# Altium project Bracelet_Main.PrjPcb (part 1 of 2)
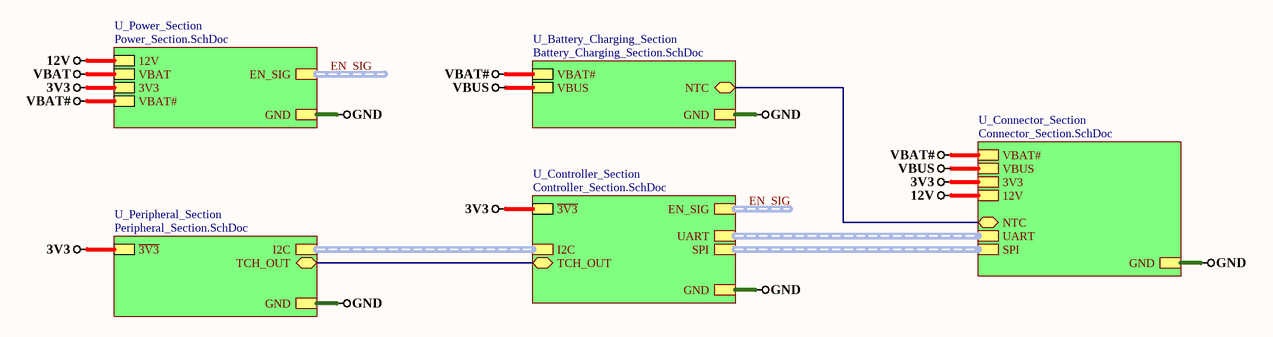
[diagram p0: Top_Sheet.SchDoc]
9 sheets, 115 parts. Net scope: hierarchical (ports join the sheet entries above them; power ports are global).
Board file: Bracelet_Main.PcbDoc
Sheets:
  Top_Sheet.SchDoc
    U_Connector_Section = Connector_Section.SchDoc
    U_Power_Section = Power_Section.SchDoc
      U_MCU_Power_Sec = MCU_Power_Sec.SchDoc
      U_LED_Power_Sec = LED_Power_Sec.SchDoc
      U_Fast_Charger_Sec = Fast_Charger_Sec.SchDoc
    U_Peripheral_Section = Peripheral_Section.SchDoc
    U_Controller_Section = Controller_Section.SchDoc
    U_Battery_Charging_Section = Battery_Charging_Section.SchDoc

## Sheet Top_Sheet.SchDoc
size A4; DocumentNumber: 1; SheetNumber: 1; SheetTotal: 9

### Sub-sheets
U_Battery_Charging_Section = Battery_Charging_Section.SchDoc: GND, VBAT#, VBUS, NTC (bidir)
U_Connector_Section = Connector_Section.SchDoc: UART (harness UART), SPI (harness SPI), NTC (bidir), 3V3, 12V, GND, VBUS, VBAT#
U_Controller_Section = Controller_Section.SchDoc: UART (harness UART), I2C (harness I2C), TCH_OUT (bidir), ~{3V3}, GND, SPI (harness SPI), EN_SIG (harness EN_SIG)
U_Peripheral_Section = Peripheral_Section.SchDoc: ~{3V3}, GND, I2C (harness I2C), TCH_OUT (bidir)
U_Power_Section = Power_Section.SchDoc: 12V, GND, VBAT, 3V3, VBAT#, EN_SIG (harness EN_SIG)

### Nets
3V3: sheet U_Connector_Section/3V3, sheet U_Power_Section/3V3, sheet U_Peripheral_Section/~{3V3}, sheet U_Controller_Section/~{3V3}
12V: sheet U_Connector_Section/12V, sheet U_Power_Section/12V
GND: sheet U_Connector_Section/GND, sheet U_Power_Section/GND, sheet U_Peripheral_Section/GND, sheet U_Controller_Section/GND, sheet U_Battery_Charging_Section/GND
VBAT#: sheet U_Connector_Section/VBAT#, sheet U_Power_Section/VBAT#, sheet U_Battery_Charging_Section/VBAT#
VBUS: sheet U_Connector_Section/VBUS, sheet U_Battery_Charging_Section/VBUS
NTC: sheet U_Connector_Section/NTC, sheet U_Battery_Charging_Section/NTC
TCH_OUT: sheet U_Peripheral_Section/TCH_OUT, sheet U_Controller_Section/TCH_OUT

### Buses and harness runs
harness EN_SIG = sheet U_Controller_Section/EN_SIG
harness EN_SIG = sheet U_Power_Section/EN_SIG
harness sheet U_Connector_Section/SPI = sheet U_Controller_Section/SPI
harness sheet U_Connector_Section/UART = sheet U_Controller_Section/UART
harness sheet U_Controller_Section/I2C = sheet U_Peripheral_Section/I2C

## Sheet Connector_Section.SchDoc
size A4; DocumentNumber: 9; SheetNumber: 9; SheetTotal: 9
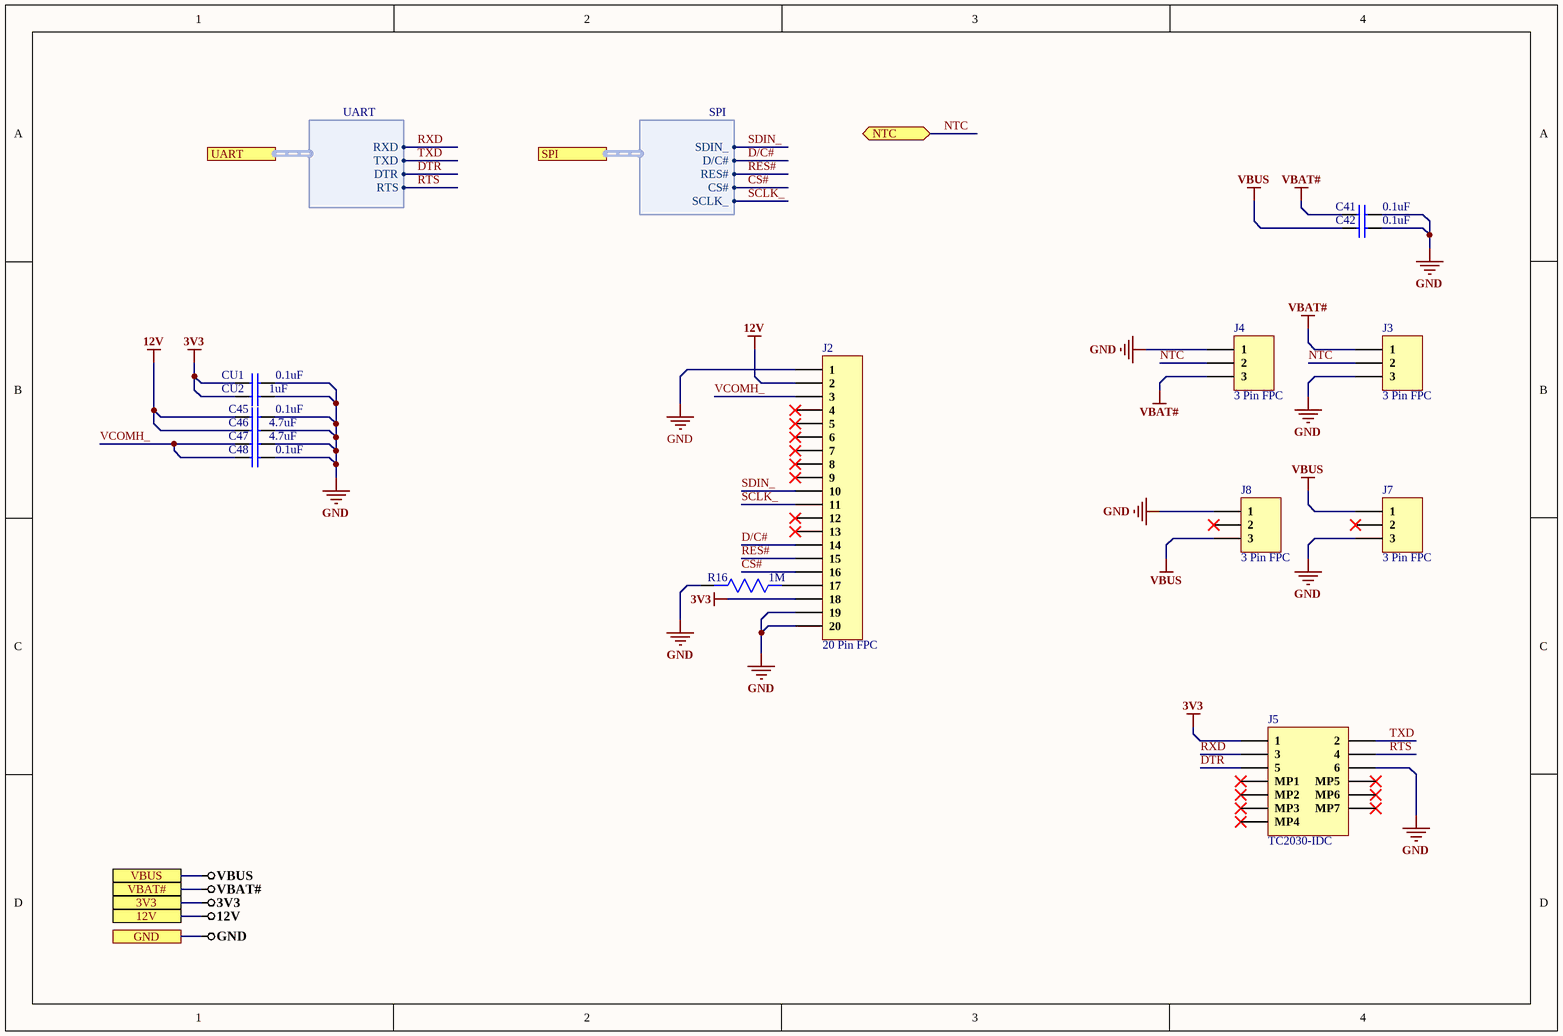
[diagram p1: Connector_Section.SchDoc]

### Parts
C41  0.1uF  [CAP 0201]
C42  0.1uF  [CAP 0201]
C45  0.1uF  [CAP 0201]
C46  4.7uF  [Cap 0402]
C47  4.7uF  [Cap 0402]
C48  0.1uF  [CAP 0201]
CU1  0.1uF  [CAP 0201]
CU2  1uF  [CAP 0201]
J2  20 Pin FPC  [20 Pin FPC]
J3  3 Pin FPC  [3 Pin FPC]
J4  3 Pin FPC  [3 Pin FPC]
J5  TC2030-IDC  [TC2030-IDC]
J7  3 Pin FPC  [3 Pin FPC]
J8  3 Pin FPC  [3 Pin FPC]
R16  1M  [Res-0201]

### Ports
3V3, 12V, GND, NTC (bidir), SPI (harness SPI), UART (harness UART), VBAT#, VBUS

### Harnesses
UART: RXD, TXD, DTR, RTS
SPI: SDIN_, D/C#, RES#, CS#, SCLK_

### Nets
3V3: CU1.1 CU2.1 J2.18 J5.1 ; port 3V3
12V: C45.1 C46.1 J2.2 ; port 12V
GND: C41.2 C42.2 C45.2 C46.2 C47.2 C48.2 CU1.2 CU2.2 J2.1 J2.19 J2.20 J3.3 J4.1 J5.6 J7.3 J8.1 R16.2 ; port GND
VBAT#: C41.1 J3.1 J4.3 ; port VBAT#
VBUS: C42.1 J7.1 J8.3 ; port VBUS
CS#: J2.16 ; port SPI.CS#
D/C#: J2.14 ; port SPI.D/C#
DTR: J5.5 ; port UART.DTR
NTC: J3.2 J4.2 ; port NTC
RES#: J2.15 ; port SPI.RES#
RTS: J5.4 ; port UART.RTS
RXD: J5.3 ; port UART.RXD
SCLK_: J2.11 ; port SPI.SCLK_
SDIN_: J2.10 ; port SPI.SDIN_
TXD: J5.2 ; port UART.TXD
VCOMH_: C47.1 C48.1 J2.3
NetJ2_17: J2.17 R16.1

Not connected (* = marked no-connect by the designer): J2 4* 5* 6* 7* 8* 9* 12* 13*; J5 MP1* MP2* MP3* MP4* MP5* MP6* MP7*; J7 2*; J8 2*

### Library data of the parts
C41 C42 C45 C48 CU1 = GRM033R61E104KE14D: Multilayer Ceramic Capacitors MLCC - SMD/SMT 0201 0.1uF 25volts X5R 10%; Manufacturer: Murata; Capacitance: 100nF; Voltage Rating: 25V; Supplier 1: Mouser; Manufacturer Part Number: GRM033R61E104KE14D; RoHS: Yes; Category: Ceramic Capacitors; Stock 1: 22478; Pricing 1: 1=0.10000, 10=0.03100, 50=0.03100, 100=0.02500, 1000=0.01700, 10000=0.01400 (USD); Mount: Surface Mount; Case/Package: 0201; Case Code (Metric): 0603; Case Code (Imperial): 0201; Weight: 1.2E-05oz; Min Operating Temperature: -55°C; Max Operating Temperature: 85°C; Packaging: Tape and Reel; Tolerance: 10%; Dielectric: X5R; Termination: SMD/SMT; Resistor Type: Ceramic; Voltage Rating (DC): 25V; Package Quantity: 15000; Length: 0.024inch; Width: 0.012inch; Height: 0.3mm; Thickness: 0.013inch; Lead Free: Lead Free; RoHS Compliant: Yes; ComponentLink1URL: http://www.farnell.com/datasheets/2867843.pdf?src-supplier=Farnell; ComponentLink1Description: http://www.farnell.com/datasheets/2867843.pdf?src-supplier=Farnell; ComponentLink2URL: http://www.mouser.com/ds/2/281/c02e-2905.pdf?src-supplier=Mouser; ComponentLink2Description: http://www.mouser.com/ds/2/281/c02e-2905.pdf?src-supplier=Mouser; ComponentLink3URL: http://search.murata.co.jp/Ceramy/image/img/A01X/G101/ENG/GRM033R61E104KE14-01.pdf?src-supplier=Digi-Key; ComponentLink3Description: http://search.murata.co.jp/Ceramy/image/img/A01X/G101/ENG/GRM033R61E104KE14-01.pdf?src-supplier=Digi-Key; ComponentLink4URL: http://www.farnell.com/datasheets/2867843.pdf?src-supplier=Newark; ComponentLink4Description: http://www.farnell.com/datasheets/2867843.pdf?src-supplier=Newark; Supplier Part Number 1: 81-GRM033R61E104KE4D
C46 C47 = CL05A475MO5NUNC: Cap Ceramic 4.7uF 16V X5R 20% SMD 0402 85C T/R; Manufacturer: Samsung; Supplier 1: Avnet; Manufacturer Part Number: CL05A475MO5NUNC; RoHS: Yes; Category: Ceramic Capacitors; Pricing 1: 1=0.63800, 25=0.44600, 100=0.26800, 250=0.23400, 500=0.20000, 1000=0.16900 (USD); Mount: Surface Mount; Case/Package: 0402; Case Code (Metric): 1005; Case Code (Imperial): 0402; Min Operating Temperature: -55°C; Max Operating Temperature: 85°C; Packaging: Tape and Reel; Capacitance: 4.7uF; Voltage Rating: 16V; Tolerance: 20%; Length: 0.039inch; Width: 0.02inch; Thickness: 0.022inch; RoHS Compliant: Yes; ComponentLink1URL: http://www.farnell.com/datasheets/2710653.pdf?src-supplier=Farnell; ComponentLink1Description: http://www.farnell.com/datasheets/2710653.pdf?src-supplier=Farnell; ComponentLink2URL: http://www.farnell.com/datasheets/2710653.pdf?src-supplier=Newark; ComponentLink2Description: http://www.farnell.com/datasheets/2710653.pdf?src-supplier=Newark; ComponentLink3URL: http://www.samsungsem.com/kr/support/product-search/mlcc/CL05A475MO5NUNC.jsp?src-supplier=Digi-Key; ComponentLink3Description: http://www.samsungsem.com/kr/support/product-search/mlcc/CL05A475MO5NUNC.jsp?src-supplier=Digi-Key; Supplier Part Number 1: 82AC9197
CU2 = CL03A105MO3NRNC: Mlcc 0201 X5R1UF16V 20% T: 0.39MM; Manufacturer: Samsung; Supplier 1: Avnet; Manufacturer Part Number: CL03A105MO3NRNC; RoHS: Yes; Category: Ceramic Capacitors; Pricing 1: 100000=0.02840, 120000=0.02800, 220000=0.02720, 500000=0.02660, 1000000=0.02560, 5000000=0.02500, 10000000=0.02440 (USD); RoHS Compliant: Yes; Supplier Part Number 1: CL03A105MO3NRNC
J2 = 20 Pin FPC: CONN FPC 20POS 0.5MM SMD R/A
J3 J4 J7 J8 = 3 Pin FPC: CONN FPC 3POS 0.5MM SMD R/A; ComponentLink1URL: https://www.molex.com/pdm_docs/pk/5051479200-200.pdf?src-supplier=Digi-Key; ComponentLink1Description: https://www.molex.com/pdm_docs/pk/5051479200-200.pdf?src-supplier=Digi-Key; ComponentLink2URL: http://www.molex.com/pdm_docs/sd/5051470390_sd.pdf?src-supplier=Digi-Key; ComponentLink2Description: http://www.molex.com/pdm_docs/sd/5051470390_sd.pdf?src-supplier=Digi-Key; ComponentLink3URL: https://www.molex.com/pdm_docs/sd/5051470390_sd.pdf?src-supplier=Digi-Key; ComponentLink3Description: https://www.molex.com/pdm_docs/sd/5051470390_sd.pdf?src-supplier=Digi-Key
J5 = TC2030-IDC: CABLE ADAPTER 6 POS; Manufacturer: Tag-Connect; ComponentLink1URL: http://www.tag-connect.com/Materials/TC2030-MCP%20Datasheet.pdf?src-supplier=Digi-Key; ComponentLink1Description: http://www.tag-connect.com/Materials/TC2030-MCP%20Datasheet.pdf?src-supplier=Digi-Key; Supplier 1: Digi-Key; Manufacturer Part Number: TC2030-IDC; Stock 1: 284; Pricing 1: 1=43.71 (USD); Package Quantity: 1; Supplier Part Number 1: TC2030-IDC-ND
R16 = WR02X105JAL: Res Thick Film 0201 1M Ohm 5% 0.05W(1/20W) ±200ppm/C Molded SMD Paper T/R; Manufacturer: Walsin Technologies; Resistance: 1MR; Supplier 1: Digi-Key; Manufacturer Part Number: WR02X105JAL; RoHS: Yes; Category: Uncategorized; Stock 1: 6920; Pricing 1: 1=0.10000, 10=0.01800, 100=0.00750, 1000=0.00335, 2500=0.00291, 5000=0.00240 (USD); Case/Package: 0201; Min Operating Temperature: -55°C; Max Operating Temperature: 125°C; Resistor Type: Thick Film; Tolerance: 5%; Packaging: Tape and Reel; Length: 0.6mm; Depth: 0.3mm; Military Standard: Not; ComponentLink1URL: http://components.arrow.com/part/dataview/0323_00666329?src-supplier=Arrow+Europe; ComponentLink1Description: http://components.arrow.com/part/dataview/0323_00666329?src-supplier=Arrow+Europe; Supplier Part Number 1: 1292-WR02X105JALCT-ND

## Sheet Power_Section.SchDoc
size A4; DocumentNumber: 3; SheetNumber: 3; SheetTotal: 9
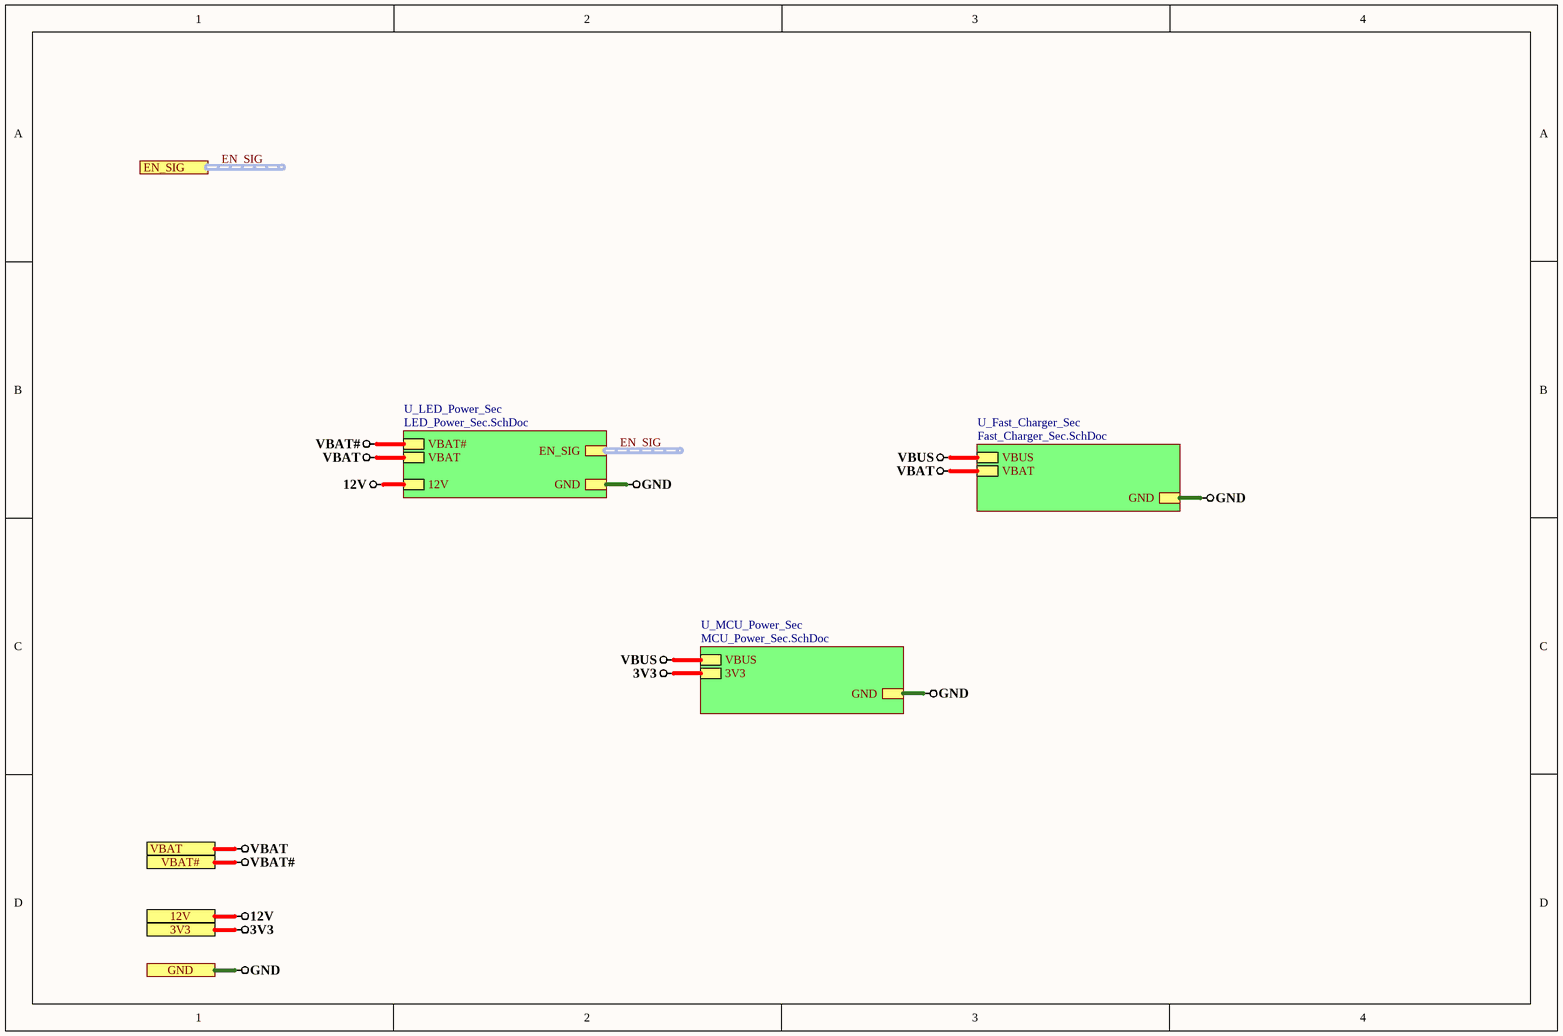
[diagram p2: Power_Section.SchDoc]

### Sub-sheets
U_Fast_Charger_Sec = Fast_Charger_Sec.SchDoc: GND, VBAT, VBUS
U_LED_Power_Sec = LED_Power_Sec.SchDoc: VBAT#, GND, VBAT, 12V, EN_SIG (harness EN_SIG)
U_MCU_Power_Sec = MCU_Power_Sec.SchDoc: VBUS, GND, 3V3

### Ports
3V3, 12V, EN_SIG (harness EN_SIG), GND, VBAT, VBAT#

### Nets
3V3: port 3V3, sheet U_MCU_Power_Sec/3V3
12V: port 12V, sheet U_LED_Power_Sec/12V
GND: port GND, sheet U_MCU_Power_Sec/GND, sheet U_LED_Power_Sec/GND, sheet U_Fast_Charger_Sec/GND
VBAT: port VBAT, sheet U_LED_Power_Sec/VBAT, sheet U_Fast_Charger_Sec/VBAT
VBAT#: port VBAT#, sheet U_LED_Power_Sec/VBAT#
VBUS: sheet U_MCU_Power_Sec/VBUS, sheet U_Fast_Charger_Sec/VBUS

### Buses and harness runs
harness EN_SIG = port EN_SIG
harness EN_SIG = sheet U_LED_Power_Sec/EN_SIG

## Sheet MCU_Power_Sec.SchDoc
size A4; DocumentNumber: 6; SheetNumber: 6; SheetTotal: 9
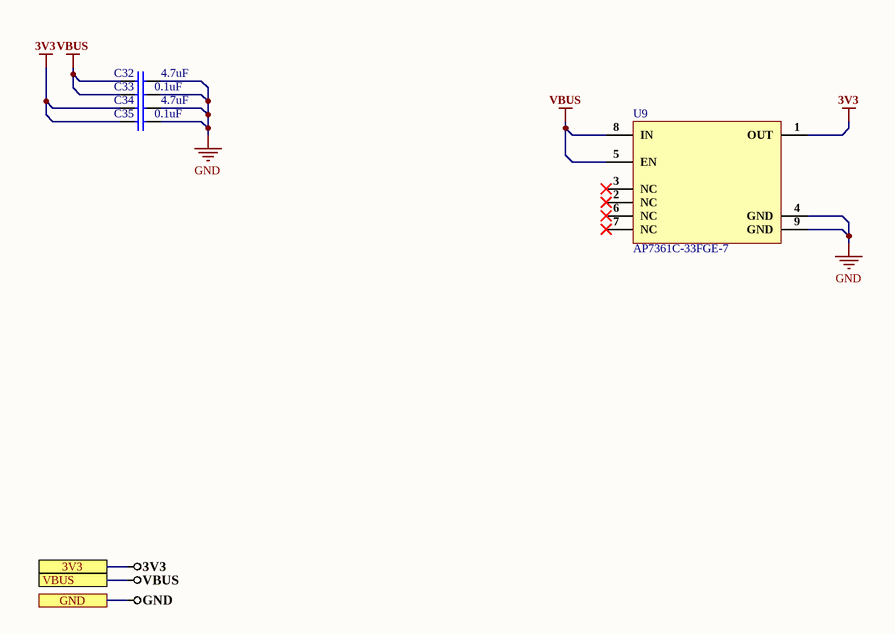
[diagram p3: MCU_Power_Sec.SchDoc]

### Parts
C32  4.7uF  [Cap 0402]
C33  0.1uF  [CAP 0201]
C34  4.7uF  [Cap 0402]
C35  0.1uF  [CAP 0201]
U9  AP7361C-33FGE-7  [U-DFN3030-8]

### Ports
3V3, GND, VBUS

### Nets
3V3: C34.1 C35.1 U9.1(OUT) ; port 3V3
GND: C32.2 C33.2 C34.2 C35.2 U9.4(GND) U9.9(GND) ; port GND
VBUS: C32.1 C33.1 U9.5(EN) U9.8(IN) ; port VBUS

Not connected (* = marked no-connect by the designer): U9 2(NC)* 3(NC)* 6(NC)* 7(NC)*

### Library data of the parts
C32 C34 = CL05A475MO5NUNC: as C46 on sheet Connector_Section; Supplier 1: Avnet; Manufacturer Part Number: CL05A475MO5NUNC; RoHS: Yes; Category: Ceramic Capacitors; Pricing 1: 1=0.63800, 25=0.44600, 100=0.26800, 250=0.23400, 500=0.20000, 1000=0.16900 (USD); Mount: Surface Mount; Case/Package: 0402; Case Code (Metric): 1005; Case Code (Imperial): 0402; Min Operating Temperature: -55°C; Max Operating Temperature: 85°C; Packaging: Tape and Reel; Capacitance: 4.7uF; Voltage Rating: 16V; Tolerance: 20%; Length: 0.039inch; Width: 0.02inch; Thickness: 0.022inch; RoHS Compliant: Yes; ComponentLink1URL: http://www.farnell.com/datasheets/2710653.pdf?src-supplier=Farnell; ComponentLink1Description: http://www.farnell.com/datasheets/2710653.pdf?src-supplier=Farnell; ComponentLink2URL: http://www.farnell.com/datasheets/2710653.pdf?src-supplier=Newark; ComponentLink2Description: http://www.farnell.com/datasheets/2710653.pdf?src-supplier=Newark; ComponentLink3URL: http://www.samsungsem.com/kr/support/product-search/mlcc/CL05A475MO5NUNC.jsp?src-supplier=Digi-Key; ComponentLink3Description: http://www.samsungsem.com/kr/support/product-search/mlcc/CL05A475MO5NUNC.jsp?src-supplier=Digi-Key; Supplier Part Number 1: 82AC9197
C33 C35 = GRM033R61E104KE14D: CAP CER 0.1UF 25V X5R 0201; Manufacturer: Murata; Capacitance: 100nF; Tolerance: 10%; Supplier 1: Mouser; Manufacturer Part Number: GRM033R61E104KE14D; RoHS: Yes; Category: Ceramic Capacitors; Stock 1: 22478; Pricing 1: 1=0.10000, 10=0.03100, 50=0.03100, 100=0.02500, 1000=0.01700, 10000=0.01400 (USD); Mount: Surface Mount; Case/Package: 0201; Case Code (Metric): 0603; Case Code (Imperial): 0201; Weight: 1.2E-05oz; Min Operating Temperature: -55°C; Max Operating Temperature: 85°C; Packaging: Tape and Reel; Voltage Rating: 25V; Dielectric: X5R; Termination: SMD/SMT; Resistor Type: Ceramic; Voltage Rating (DC): 25V; Package Quantity: 15000; Length: 0.024inch; Width: 0.012inch; Height: 0.3mm; Thickness: 0.013inch; Lead Free: Lead Free; RoHS Compliant: Yes; ComponentLink1URL: http://www.farnell.com/datasheets/2867843.pdf?src-supplier=Farnell; ComponentLink1Description: http://www.farnell.com/datasheets/2867843.pdf?src-supplier=Farnell; ComponentLink2URL: http://www.mouser.com/ds/2/281/c02e-2905.pdf?src-supplier=Mouser; ComponentLink2Description: http://www.mouser.com/ds/2/281/c02e-2905.pdf?src-supplier=Mouser; ComponentLink3URL: http://search.murata.co.jp/Ceramy/image/img/A01X/G101/ENG/GRM033R61E104KE14-01.pdf?src-supplier=Digi-Key; ComponentLink3Description: http://search.murata.co.jp/Ceramy/image/img/A01X/G101/ENG/GRM033R61E104KE14-01.pdf?src-supplier=Digi-Key; ComponentLink4URL: http://www.farnell.com/datasheets/2867843.pdf?src-supplier=Newark; ComponentLink4Description: http://www.farnell.com/datasheets/2867843.pdf?src-supplier=Newark; Supplier Part Number 1: 81-GRM033R61E104KE4D
U9 = AP7361C-33FGE-7: IC REG LINEAR 3.3V 1A UDFN3030-8; Manufacturer: Diodes; Dropout Voltage: 360mV; Number of Regulators: 1; Min Current Limit: 1.1A; Supplier 1: Digi-Key; Manufacturer Part Number: AP7361C-33FGE-7; RoHS: Yes; Category: Voltage Regulators - Linear; Stock 1: 84; Pricing 1: 1=0.56000, 10=0.48100, 25=0.44880, 100=0.35910, 250=0.33348, 500=0.28218, 1000=0.21804 (USD); Mount: Surface Mount; Min Operating Temperature: -40°C; Max Operating Temperature: 85°C; Packaging: Tape and Reel; Output Voltage: 3.3V; Output Current: 1A; RoHS Compliant: Yes; ComponentLink1URL: http://www.mouser.com/ds/2/115/AP7361C-775034.pdf?src-supplier=Mouser; ComponentLink1Description: http://www.mouser.com/ds/2/115/AP7361C-775034.pdf?src-supplier=Mouser; ComponentLink2URL: https://www.diodes.com/assets/Datasheets/AP7361C.pdf?src-supplier=Digi-Key; ComponentLink2Description: https://www.diodes.com/assets/Datasheets/AP7361C.pdf?src-supplier=Digi-Key; Supplier Part Number 1: AP7361C-33FGE-7DICT-ND

## Sheet LED_Power_Sec.SchDoc
size A4; DocumentNumber: 4; SheetNumber: 4; SheetTotal: 9
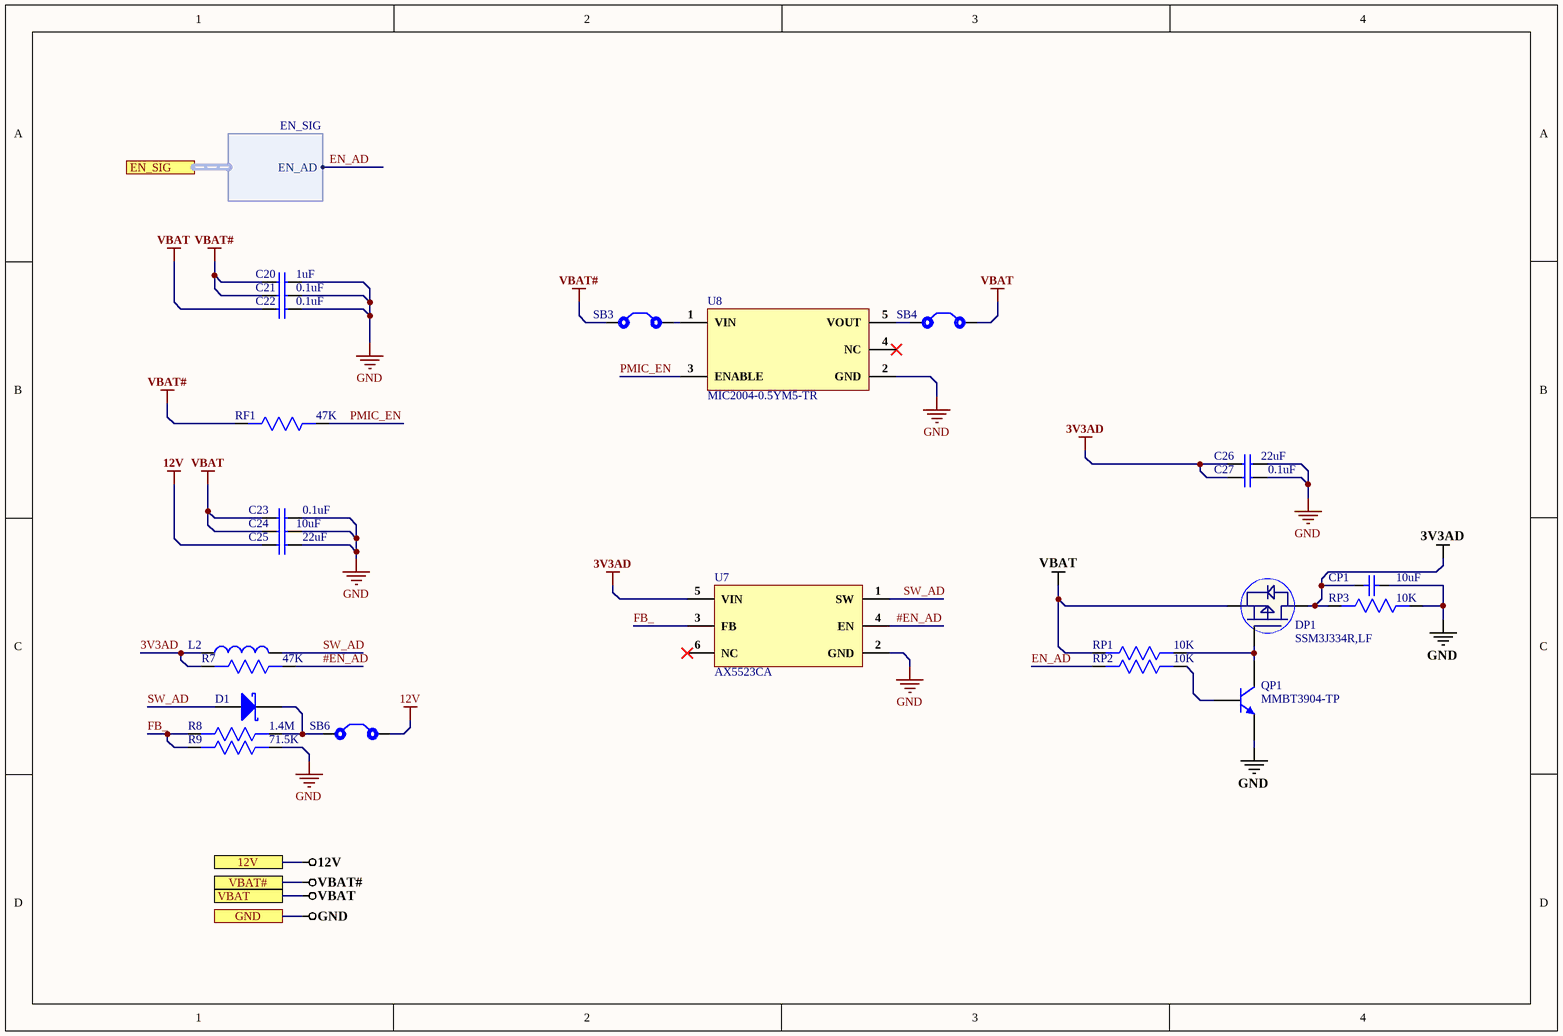
[diagram p4: LED_Power_Sec.SchDoc]

### Parts
C20  1uF  [CAP 0201]
C21  0.1uF  [CAP 0201]
C22  0.1uF  [CAP 0201]
C23  0.1uF  [CAP 0201]
C24  10uF  [Cap 0402]
C25  22uF  [Cap0805]
C26  22uF  [Cap0603]
C27  0.1uF  [CAP 0201]
CP1  10uF  [Cap0603]
D1  PMEG3010ER,115  [SOD123W]  (value not drawn)
DP1  SSM3J334R,LF  [SOT-23F]
L2  MS0420-100M  [MS0420-100M]  (value not drawn)
QP1  MMBT3904-TP  [SOT-23F]
R7  47K  [Res-0201]
R8  1.4M  [Res-0201]
R9  71.5K  [Res-0201]
RF1  47K  [Res-0201]
RP1  10K  [Res-0201]
RP2  10K  [Res-0201]
RP3  10K  [Res-0201]
SB3  Solder Bridge  [Solder Bridge]  (value not drawn)
SB4  Solder Bridge  [Solder Bridge]  (value not drawn)
SB6  Solder Bridge  [Solder Bridge]  (value not drawn)
U7  AX5523CA  [SOT-23-6]
U8  MIC2004-0.5YM5-TR  [SOT-23-5]

### Ports
12V, EN_SIG (harness EN_SIG), GND, VBAT, VBAT#

### Harnesses
EN_SIG: EN_AD

### Nets
3V3AD: C26.1 C27.1 CP1.2 DP1.3(D) L2.1 R7.2 RP3.2 U7.5(VIN)
12V: C25.1 SB6.2 ; port 12V
GND: C20.2 C21.2 C22.2 C23.2 C24.2 C25.2 C26.2 C27.2 CP1.1 QP1.2(E) R9.1 RP3.1 U7.2(GND) U8.2(GND) ; port GND
VBAT: C22.1 C23.1 C24.1 DP1.2(S) RP1.2 SB4.2 ; port VBAT
VBAT#: C20.1 C21.1 RF1.2 SB3.1 ; port VBAT#
#EN_AD: R7.1 U7.4(EN)
EN_AD: RP2.2 ; port EN_SIG.EN_AD
FB_: R8.2 R9.2 U7.3(FB)
PMIC_EN: RF1.1 U8.3(ENABLE)
SW_AD: D1.A L2.2 U7.1(SW)
NetD1_K: D1.K R8.1 SB6.1
NetDP1_1: DP1.1(G) QP1.3(C) RP1.1
NetQP1_1: QP1.1(B) RP2.1
NetSB3_2: SB3.2 U8.1(VIN)
NetSB4_1: SB4.1 U8.5(VOUT)

Not connected (* = marked no-connect by the designer): U7 6(NC)*; U8 4(NC)*

### Library data of the parts
C20 = CL03A105MO3NRNC: as CU2 on sheet Connector_Section; Supplier 1: Avnet; Manufacturer Part Number: CL03A105MO3NRNC; RoHS: Yes; Category: Ceramic Capacitors; Pricing 1: 100000=0.02840, 120000=0.02800, 220000=0.02720, 500000=0.02660, 1000000=0.02560, 5000000=0.02500, 10000000=0.02440 (USD); RoHS Compliant: Yes; Supplier Part Number 1: CL03A105MO3NRNC
C21-C23 C27 = GRM033R61E104KE14D: as C41 on sheet Connector_Section; Supplier 1: Mouser; Manufacturer Part Number: GRM033R61E104KE14D; RoHS: Yes; Category: Ceramic Capacitors; Stock 1: 22478; Pricing 1: 1=0.10000, 10=0.03100, 50=0.03100, 100=0.02500, 1000=0.01700, 10000=0.01400 (USD); Mount: Surface Mount; Case/Package: 0201; Case Code (Metric): 0603; Case Code (Imperial): 0201; Weight: 1.2E-05oz; Min Operating Temperature: -55°C; Max Operating Temperature: 85°C; Packaging: Tape and Reel; Tolerance: 10%; Dielectric: X5R; Termination: SMD/SMT; Resistor Type: Ceramic; Voltage Rating (DC): 25V; Package Quantity: 15000; Length: 0.024inch; Width: 0.012inch; Height: 0.3mm; Thickness: 0.013inch; Lead Free: Lead Free; RoHS Compliant: Yes; ComponentLink1URL: http://www.farnell.com/datasheets/2867843.pdf?src-supplier=Farnell; ComponentLink1Description: http://www.farnell.com/datasheets/2867843.pdf?src-supplier=Farnell; ComponentLink2URL: http://www.mouser.com/ds/2/281/c02e-2905.pdf?src-supplier=Mouser; ComponentLink2Description: http://www.mouser.com/ds/2/281/c02e-2905.pdf?src-supplier=Mouser; ComponentLink3URL: http://search.murata.co.jp/Ceramy/image/img/A01X/G101/ENG/GRM033R61E104KE14-01.pdf?src-supplier=Digi-Key; ComponentLink3Description: http://search.murata.co.jp/Ceramy/image/img/A01X/G101/ENG/GRM033R61E104KE14-01.pdf?src-supplier=Digi-Key; ComponentLink4URL: http://www.farnell.com/datasheets/2867843.pdf?src-supplier=Newark; ComponentLink4Description: http://www.farnell.com/datasheets/2867843.pdf?src-supplier=Newark; Supplier Part Number 1: 81-GRM033R61E104KE4D
C24 = GRM155R61A106ME44D: 10uF ±20% 10V X5R 0402 Multilayer Ceramic Capacitors MLCC - SMD/SMT RoHS; Manufacturer: Murata Electronics; Package: 0402; Capacitance: 10uF; Tolerance: ±20%; Voltage - Rated: Voltage - Rated; Temperature Coefficient: X5R
C25 = CL21A226MOQNNNE: CAP CER 22UF 16V X5R 0805; Manufacturer: Samsung; Tolerance: 20%; Supplier 1: Digi-Key; Manufacturer Part Number: CL21A226MOQNNNE; RoHS: Yes; Category: Ceramic Capacitors; Stock 1: 91301; Pricing 1: 1=0.30000, 10=0.20900, 50=0.13900, 100=0.11820, 500=0.08344, 1000=0.07301 (USD); Mount: Surface Mount; Case/Package: 0805; Case Code (Metric): 2012; Case Code (Imperial): 0805; Contact Plating: Tin; Min Operating Temperature: -55°C; Max Operating Temperature: 85°C; Package Quantity: 1; Packaging: Cut Tape; Capacitance: 22uF; Voltage Rating: 16V; Dielectric: X5R; Voltage Rating (DC): 16V; Termination: Wraparound; Series: CL; Construction: Flat; Length: 0.079inch; Width: 0.049inch; Thickness: 0.055inch; RoHS Compliant: Yes; Lead Free: Lead Free; ComponentLink1URL: https://datasheet.ciiva.com/25724/cl21a226moqnnne-25724832.pdf?src-supplier=Digi-Key; ComponentLink1Description: https://datasheet.ciiva.com/25724/cl21a226moqnnne-25724832.pdf?src-supplier=Digi-Key; Supplier Part Number 1: 1276-2909-1-ND
C26 = GRT188R61A226ME13D: Cap Ceramic Monolithic 22uF 10VDC 20% SMD Paper T/R; Manufacturer: Murata; Supplier 1: Avnet; Manufacturer Part Number: GRT188R61A226ME13D; RoHS: Yes; Pricing 1: 4000=0.10936, 8000=0.10684, 16000=0.10534, 24000=0.10233, 32000=0.10007 (USD); Supplier Part Number 1: GRT188R61A226ME13D
CP1 = GRM188R61E106KA73D: CAP CER 10UF 25V X5R 0603; Manufacturer: Murata; Supplier 1: Mouser; Manufacturer Part Number: GRM188R61E106KA73D; RoHS: Yes; Category: Ceramic Capacitors; Stock 1: 319428; Pricing 1: 1=0.36000, 10=0.25800, 50=0.25800, 100=0.15500, 1000=0.09800, 10000=0.06900 (USD); Case/Package: 0603; RoHS Compliant: Yes; ComponentLink1URL: https://search.murata.co.jp/Ceramy/image/img/A01X/G101/ENG/GRM188R61E106KA73-01.pdf?src-supplier=Digi-Key; ComponentLink1Description: https://search.murata.co.jp/Ceramy/image/img/A01X/G101/ENG/GRM188R61E106KA73-01.pdf?src-supplier=Digi-Key; Supplier Part Number 1: 81-GRM188R61E106KA3D
D1 = PMEG3010ER,115: DIODE SCHOTTKY 30V 1A SOD123W; Manufacturer: Nexperia; Supplier 1: Digi-Key; Manufacturer Part Number: PMEG3010ER,115; Stock 1: 75070; Pricing 1: 1=0.36, 10=0.29, 100=0.1669, 500=0.1545, 1000=0.10506 (USD); Supplier Part Number 1: 1727-5201-1-ND
DP1 = SSM3J334R,LF: MOSFET P-CH 30V 4A SOT23F; Manufacturer: Toshiba; Number of Elements: 1; Element Configuration: Single; Drain to Source Breakdown Voltage: -30V; Rds On Max: 71mR; Input Capacitance: 280pF; Gate to Source Voltage (Vgs): 20V; Drain to Source Resistance: 136mR; Power Dissipation: 1W; Supplier 1: Digi-Key; Manufacturer Part Number: SSM3J334R,LF; RoHS: Yes; Category: MOSFETs; Stock 1: 79343; Pricing 1: 1=0.47000, 10=0.33100, 25=0.30800, 100=0.16720, 500=0.13640, 1000=0.10120 (USD); Mount: Surface Mount; Case/Package: SOT-23-3; Number of Pins: 3; Min Operating Temperature: -55°C; Max Operating Temperature: 150°C; Packaging: Tape and Reel; Package Quantity: 1; Drain to Source Voltage (Vdss): 30V; Continuous Drain Current (ID): 4A; Max Power Dissipation: 1W; ComponentLink1URL: https://datasheet.ciiva.com/6375/ssm3j334r-datasheet-en-20140301-6375723.pdf?src-supplier=Digi-Key; ComponentLink1Description: https://datasheet.ciiva.com/6375/ssm3j334r-datasheet-en-20140301-6375723.pdf?src-supplier=Digi-Key; ComponentLink2URL: https://datasheet.ciiva.com/6373/ssm3j334r-datasheet-en-20140301-6373837.pdf?src-supplier=Digi-Key; ComponentLink2Description: https://datasheet.ciiva.com/6373/ssm3j334r-datasheet-en-20140301-6373837.pdf?src-supplier=Digi-Key; Supplier Part Number 1: SSM3J334RLFCT-ND
L2 = MS0420-100M: 10uH ±20% 1.6A 230mΩ SMD,4.75x4.2x2mm Inductors (SMD) RoHS; Manufacturer: COILMX; Manufacturer Part No: MS0420-100M; Package: Custom; Value: 10uH
QP1 = MMBT3904-TP: TRANS NPN 40V 0.2A SOT23; Manufacturer: MCC; Max Power Dissipation: 350mW; Number of Elements: 1; hFE Min: 40; Frequency: 300MHz; Max Collector Current: 200mA; Collector Base Voltage (VCBO): 60V; Emitter Base Voltage (VEBO): 6V; Collector Emitter Saturation Voltage: 300mV; Element Configuration: Single; Current Rating: 100mA; Supplier 1: Digi-Key; Manufacturer Part Number: MMBT3904-TP; RoHS: Yes; Category: BJTs; Stock 1: 659192; Pricing 1: 1=0.10000, 10=0.06300, 25=0.06000, 100=0.03380, 500=0.02656, 1000=0.01844 (USD); Mount: Surface Mount; Case/Package: SOT-23; Number of Pins: 3; Min Operating Temperature: -55°C; Max Operating Temperature: 150°C; Package Quantity: 1; Collector Emitter Voltage (VCEO): 40V; Packaging: Tape and Reel; Transition Frequency: 300MHz; Collector Emitter Breakdown Voltage: 40V; Polarity: NPN; Max Breakdown Voltage: 40V; Power Dissipation: 350mW; Max Frequency: 300MHz; Gain Bandwidth Product: 300MHz; Voltage Rating (DC): 40V; Series: -; Collector-emitter Voltage-Max: 300mV; Length: 3.04mm; Width: 1.4mm; Height: 1.12mm; Radiation Hardening: No; Lead Free: Lead Free; RoHS Compliant: Yes; ComponentLink1URL: https://datasheet.ciiva.com/16291/mmbt3904sot-23-37005-16291911.pdf?src-supplier=Mouser; ComponentLink1Description: https://datasheet.ciiva.com/16291/mmbt3904sot-23-37005-16291911.pdf?src-supplier=Mouser; ComponentLink2URL: https://datasheet.ciiva.com/15139/getdatasheetpartid-251950-15139820.pdf?src-supplier=Verical; ComponentLink2Description: https://datasheet.ciiva.com/15139/getdatasheetpartid-251950-15139820.pdf?src-supplier=Verical; ComponentLink3URL: https://datasheet.ciiva.com/972/mmbt3904sot-23-972515.pdf?src-supplier=Digi-Key; ComponentLink3Description: https://datasheet.ciiva.com/972/mmbt3904sot-23-972515.pdf?src-supplier=Digi-Key; ComponentLink4URL: https://datasheet.ciiva.com/16742/mmbt3904tsot-523-16742101.pdf?src-supplier=Future+Electronics; ComponentLink4Description: https://datasheet.ciiva.com/16742/mmbt3904tsot-523-16742101.pdf?src-supplier=Future+Electronics; ComponentLink5URL: https://datasheet.ciiva.com/972/mmbt3904sot-23-972516.pdf?src-supplier=Digi-Key; ComponentLink5Description: https://datasheet.ciiva.com/972/mmbt3904sot-23-972516.pdf?src-supplier=Digi-Key; ComponentLink6URL: https://datasheet.ciiva.com/14546/70055699-14546053.pdf?src-supplier=Allied+Electronics; ComponentLink6Description: https://datasheet.ciiva.com/14546/70055699-14546053.pdf?src-supplier=Allied+Electronics; Supplier Part Number 1: MMBT3904TPMSCT-ND
R7 RF1 = RC0201FR-0747KL: GENERAL 0201 11% REEL (7INCH); Manufacturer: Yageo; Temperature Coefficient: 200ppm/°C; Resistance: 47kR; Tolerance: 1%; Power Rating: 50mW; Voltage Rating: 25V; Supplier 1: Digi-Key; Manufacturer Part Number: RC0201FR-0747KL; RoHS: Yes; Category: Chip SMD Resistors; Stock 1: 407876; Pricing 1: 1=0.10000, 10=0.04200, 100=0.01700, 1000=0.00765, 2500=0.00664, 5000=0.00548 (USD); Case/Package: 0201; Contact Plating: Tin,Matte; Weight: 6E-06oz; Case Code (Metric): 0603; Case Code (Imperial): 0201; Min Operating Temperature: -55°C; Max Operating Temperature: 125°C; Resistor Type: Thick Film; Number of Terminations: 2; Termination: SMD/SMT; Features: Moisture Resistant; Packaging: Tape and Reel; Package Quantity: 1; Max Power Dissipation: 50mW; Length: 0.6mm; Width: 0.012inch; Height: 0.01inch; Depth: 0.3mm; Radiation Hardening: No; Military Standard: Not; Lead Free: Lead Free; REACH SVHC: Unknown; ComponentLink1URL: https://datasheet.ciiva.com/28399/pyu-rc0201-51-rohs-l-8-28399335.pdf?src-supplier=Avnet+Europe; ComponentLink1Description: https://datasheet.ciiva.com/28399/pyu-rc0201-51-rohs-l-8-28399335.pdf?src-supplier=Avnet+Europe; ComponentLink2URL: https://datasheet.ciiva.com/29710/pyu-r-int-thick-7-29710919.pdf?src-supplier=Digi-Key; ComponentLink2Description: https://datasheet.ciiva.com/29710/pyu-r-int-thick-7-29710919.pdf?src-supplier=Digi-Key; ComponentLink3URL: https://datasheet.ciiva.com/7672/1563626-7672232.pdf?src-supplier=Element14; ComponentLink3Description: https://datasheet.ciiva.com/7672/1563626-7672232.pdf?src-supplier=Element14; ComponentLink4URL: https://datasheet.ciiva.com/29710/pyu-r-int-thick-7-29710920.pdf?src-supplier=Digi-Key; ComponentLink4Description: https://datasheet.ciiva.com/29710/pyu-r-int-thick-7-29710920.pdf?src-supplier=Digi-Key; ComponentLink5URL: https://datasheet.ciiva.com/8889/pyu-rc0201-51-rohs-l-8-8889065.pdf?src-supplier=Avnet; ComponentLink5Description: https://datasheet.ciiva.com/8889/pyu-rc0201-51-rohs-l-8-8889065.pdf?src-supplier=Avnet; ComponentLink6URL: https://datasheet.ciiva.com/26829/getdatasheetpartid-422496-26829867.pdf?src-supplier=Verical; ComponentLink6Description: https://datasheet.ciiva.com/26829/getdatasheetpartid-422496-26829867.pdf?src-supplier=Verical; ComponentLink7URL: https://datasheet.ciiva.com/16855/pyu-rc0201-51-rohs-l-8-16855917.pdf?src-supplier=Avnet+Europe; ComponentLink7Description: https://datasheet.ciiva.com/16855/pyu-rc0201-51-rohs-l-8-16855917.pdf?src-supplier=Avnet+Europe; ComponentLink8URL: https://datasheet.ciiva.com/25647/pyu-r-int-thick-7-25647310.pdf?src-supplier=Digi-Key; ComponentLink8Description: https://datasheet.ciiva.com/25647/pyu-r-int-thick-7-25647310.pdf?src-supplier=Digi-Key; Supplier Part Number 1: 311-47KMCT-ND
R8 = 0201WMF1404TEE: 1.4MΩ ±1% 1/20W ±200ppm/℃ 0201 Chip Resistor - Surface Mount RoHS; Manufacturer: UNI-ROYAL(Uniroyal Elec); Package: 0201; Resistance: 1.4MΩ; Tolerance: ±1%; Power(Watts): 1/20W; Temperature Coefficient: ±200ppm/℃
R9 = 0201WMF7152TEE: 71.5kΩ ±1% 0.05W ±200ppm/℃ 0201 Chip Resistor - Surface Mount RoHS; Manufacturer: UNI-ROYAL(Uniroyal Elec); Package: 0201; Resistance: 71.5kΩ; Tolerance: ±1%; Power(Watts): Power(Watts); Temperature Coefficient1: ±200ppm/℃
RP1-RP3 = RC0201FR-0710KL: GENERAL 0201 11% REEL (7INCH); Manufacturer: Yageo; Temperature Coefficient: 200ppm/°C; Resistance: 10kR; Tolerance: 1%; Max Power Dissipation: 50mW; Working Voltage: 25V; Supplier 1: Digi-Key; Manufacturer Part Number: RC0201FR-0710KL; RoHS: Yes; Category: Chip SMD Resistors; Stock 1: 6892350; Pricing 1: 1=0.10000, 10=0.03600, 100=0.01480, 1000=0.00665, 2500=0.00577, 5000=0.00477 (USD); Case/Package: 0201; Number of Pins: 2; Contact Plating: Tin,Matte; Weight: 6E-06oz; Case Code (Imperial): 0201; Case Code (Metric): 0603; Min Operating Temperature: -55°C; Max Operating Temperature: 125°C; Resistor Type: Thick Film; Features: Moisture Resistant; Termination: SMD/SMT; Number of Terminations: 2; Power Rating: 50mW; Voltage Rating: 25V; Packaging: Tape and Reel; Package Quantity: 1; Voltage Rating (DC): 25V; Length: 0.6mm; Width: 0.3mm; Height: 0.01inch; Depth: 0.3mm; Radiation Hardening: No; REACH SVHC: No SVHC; Military Standard: Not; Lead Free: Lead Free; ComponentLink1URL: https://datasheet.ciiva.com/2467/pyu-r-int-thick-7-2467109.pdf?src-supplier=Digi-Key; ComponentLink1Description: https://datasheet.ciiva.com/2467/pyu-r-int-thick-7-2467109.pdf?src-supplier=Digi-Key; ComponentLink2URL: https://datasheet.ciiva.com/2467/pyu-r-int-thick-7-2467110.pdf?src-supplier=Digi-Key; ComponentLink2Description: https://datasheet.ciiva.com/2467/pyu-r-int-thick-7-2467110.pdf?src-supplier=Digi-Key; ComponentLink3URL: https://datasheet.ciiva.com/2467/pyu-r-int-thick-7-2467111.pdf?src-supplier=Digi-Key; ComponentLink3Description: https://datasheet.ciiva.com/2467/pyu-r-int-thick-7-2467111.pdf?src-supplier=Digi-Key; ComponentLink4URL: https://datasheet.ciiva.com/7660/1421516-7660807.pdf?src-supplier=Element14; ComponentLink4Description: https://datasheet.ciiva.com/7660/1421516-7660807.pdf?src-supplier=Element14; ComponentLink5URL: https://datasheet.ciiva.com/8891/pyu-rc0201-51-rohs-l-8-8891384.pdf?src-supplier=Avnet; ComponentLink5Description: https://datasheet.ciiva.com/8891/pyu-rc0201-51-rohs-l-8-8891384.pdf?src-supplier=Avnet; ComponentLink6URL: https://datasheet.ciiva.com/28405/pyu-rc0201-51-rohs-l-8-28405609.pdf?src-supplier=Avnet+Europe; ComponentLink6Description: https://datasheet.ciiva.com/28405/pyu-rc0201-51-rohs-l-8-28405609.pdf?src-supplier=Avnet+Europe; ComponentLink7URL: https://datasheet.ciiva.com/26829/getdatasheetpartid-421074-26829851.pdf?src-supplier=Verical; ComponentLink7Description: https://datasheet.ciiva.com/26829/getdatasheetpartid-421074-26829851.pdf?src-supplier=Verical; ComponentLink8URL: https://datasheet.ciiva.com/46391/1421516-46391339.pdf?src-supplier=Element14; ComponentLink8Description: https://datasheet.ciiva.com/46391/1421516-46391339.pdf?src-supplier=Element14; ComponentLink9URL: https://datasheet.ciiva.com/16855/pyu-rc0201-51-rohs-l-8-16855789.pdf?src-supplier=Avnet+Europe; ComponentLink9Description: https://datasheet.ciiva.com/16855/pyu-rc0201-51-rohs-l-8-16855789.pdf?src-supplier=Avnet+Europe; Supplier Part Number 1: 311-10.0KMCT-ND
SB3 SB4 SB6 = Solder Bridge: Solder Bridge ON
U7 = AX5523CA: Step-Up Positive Adjustable 1 2A 1.2MHz SOT-23-6 DC-DC Converters RoHS; Manufacturer: Axelite Tech; Manufacturer Part No: AX5523CA; Package: SOT-23-6; Value: *
U8 = MIC2004-0.5YM5-TR: IC PWR SWITCH P-CHAN 1:1 SOT23-5; Manufacturer: Microchip; Supplier 1: Digi-Key; Manufacturer Part Number: MIC2004-0.5YM5-TR; RoHS: Yes; Category: Hot Swap Controllers; Stock 1: 5462; Pricing 1: 1=0.79000, 25=0.65000, 100=0.59000 (USD); ComponentLink1URL: http://components.arrow.com/part/dataview/42608079S9274031N1374?src-supplier=Arrow+Electronics; ComponentLink1Description: http://components.arrow.com/part/dataview/42608079S9274031N1374?src-supplier=Arrow+Electronics; ComponentLink2URL: http://uk.rs-online.com/webdocs/0f82/0900766b80f822a9.pdf?src-supplier=RSComponents; ComponentLink2Description: http://uk.rs-online.com/webdocs/0f82/0900766b80f822a9.pdf?src-supplier=RSComponents; ComponentLink3URL: http://components.arrow.com/part/dataview/0323_00165048?src-supplier=Arrow+Europe; ComponentLink3Description: http://components.arrow.com/part/dataview/0323_00165048?src-supplier=Arrow+Europe; ComponentLink4URL: http://www.mouser.com/ds/2/268/mic20xx-778478.pdf?src-supplier=Mouser; ComponentLink4Description: http://www.mouser.com/ds/2/268/mic20xx-778478.pdf?src-supplier=Mouser; ComponentLink5URL: http://www.farnell.com/datasheets/1670778.pdf?src-supplier=Element14; ComponentLink5Description: http://www.farnell.com/datasheets/1670778.pdf?src-supplier=Element14; ComponentLink6URL: http://www.microchip.com/mymicrochip/filehandler.aspx?ddocname=en579487&src-supplier=Digi-Key; ComponentLink6Description: http://www.microchip.com/mymicrochip/filehandler.aspx?ddocname=en579487&src-supplier=Digi-Key; ComponentLink7URL: http://www.micrel.com/_PDF/mic20xx.pdf?src-supplier=Future+Electronics; ComponentLink7Description: http://www.micrel.com/_PDF/mic20xx.pdf?src-supplier=Future+Electronics; Supplier Part Number 1: 576-2582-1-ND

## Sheet Fast_Charger_Sec.SchDoc
size A4; DocumentNumber: 5; SheetNumber: 5; SheetTotal: 9
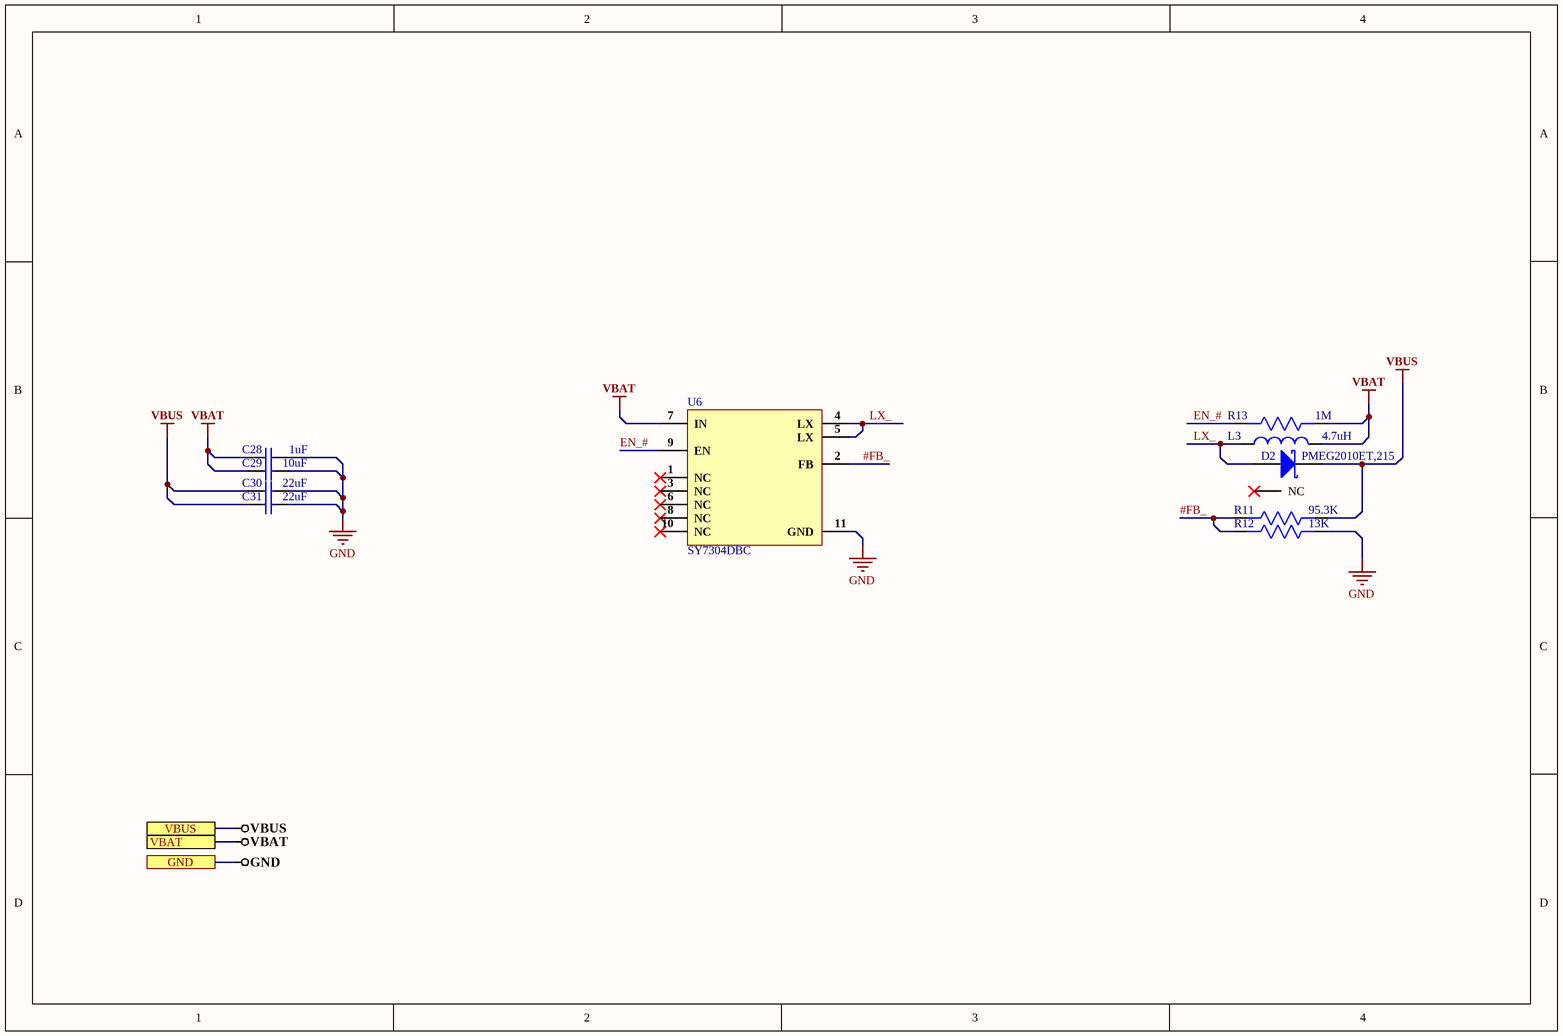
[diagram p5: Fast_Charger_Sec.SchDoc]

### Parts
C28  1uF  [CAP 0201]
C29  10uF  [Cap 0402]
C30  22uF  [Cap0603]
C31  22uF  [Cap0603]
D2  PMEG2010ET,215  [PMEG2010ET,215]
L3  4.7uH  [AMDLA4530Q-4R7MT]
R11  95.3K  [Res-0201]
R12  13K  [Res-0201]
R13  1M  [Res-0201]
U6  SY7304DBC  [DFN-10]

### Ports
GND, VBAT, VBUS

### Nets
GND: C28.2 C29.2 C30.2 C31.2 R12.1 U6.11(GND) ; port GND
VBAT: C28.1 C29.1 L3.2 R13.1 U6.7(IN) ; port VBAT
VBUS: C30.1 C31.1 D2.3 R11.1 ; port VBUS
#FB_: R11.2 R12.2 U6.2(FB)
EN_#: R13.2 U6.9(EN)
LX_: D2.1 L3.1 U6.4(LX) U6.5(LX)

Not connected (* = marked no-connect by the designer): D2 2(NC)*; U6 1(NC)* 3(NC)* 6(NC)* 8(NC)* 10(NC)*

### Library data of the parts
C28 = CL03A105MO3NRNC: as CU2 on sheet Connector_Section; Supplier 1: Avnet; Manufacturer Part Number: CL03A105MO3NRNC; RoHS: Yes; Category: Ceramic Capacitors; Pricing 1: 100000=0.02840, 120000=0.02800, 220000=0.02720, 500000=0.02660, 1000000=0.02560, 5000000=0.02500, 10000000=0.02440 (USD); RoHS Compliant: Yes; Supplier Part Number 1: CL03A105MO3NRNC
C29 = GRM155R61A106ME44D: as C24 on sheet LED_Power_Sec; Package: 0402; Capacitance: 10uF; Tolerance: ±20%; Voltage - Rated: Voltage - Rated; Temperature Coefficient: X5R
C30 C31 = GRT188R61A226ME13D: as C26 on sheet LED_Power_Sec; Supplier 1: Avnet; Manufacturer Part Number: GRT188R61A226ME13D; RoHS: Yes; Pricing 1: 4000=0.10936, 8000=0.10684, 16000=0.10534, 24000=0.10233, 32000=0.10007 (USD); Supplier Part Number 1: GRT188R61A226ME13D
D2 = PMEG2010ET,215: DIODE SCHOTTKY 20V 1A TO236AB; Manufacturer: NXP Semiconductors; Max Reverse Current: 200uA; Peak Non-Repetitive Surge Current: 9A; Element Configuration: Single; Max Power Dissipation: 420mW; Forward Voltage: 500mV; Supplier 1: Digi-Key; Manufacturer Part Number: PMEG2010ET,215; Stock 1: 13; Pricing 1: 1=0.46, 10=0.376, 100=0.2563, 500=0.1922, 1000=0.14414 (USD); Mount: Surface Mount; Case/Package: TO-236AB; Number of Pins: 3; Min Operating Temperature: -65°C; Max Operating Temperature: 150°C; Forward Current: 1A; Max Repetitive Reverse Voltage (Vrrm): 20V; Package Quantity: 1; Packaging: Tape and Reel; Max Surge Current: 9A; Average Rectified Current: 1A; Max Reverse Leakage Current: 200uA; Max Reverse Voltage (DC): 20V; Series: -; Radiation Hardening: No; RoHS Compliant: Yes; Lead Free: Lead Free; ComponentLink1URL: http://www.nxp.com/documents/data_sheet/PMEG2010EH_EJ_ET.pdf?src-supplier=Digi-Key; ComponentLink1Description: http://www.nxp.com/documents/data_sheet/PMEG2010EH_EJ_ET.pdf?src-supplier=Digi-Key; ComponentLink2URL: http://www.nxp.com/documents/data_sheet/PMEG2010EH_EJ_ET.pdf?ecmp=mouser&src-supplier=Mouser; ComponentLink2Description: http://www.nxp.com/documents/data_sheet/PMEG2010EH_EJ_ET.pdf?ecmp=mouser&src-supplier=Mouser; ComponentLink3URL: http://www.nxp.com/documents/data_sheet/PMEG2010EH_EJ_ET.pdf?src-supplier=Avnet; ComponentLink3Description: http://www.nxp.com/documents/data_sheet/PMEG2010EH_EJ_ET.pdf?src-supplier=Avnet; ComponentLink4URL: http://www.nxp.com/documents/data_sheet/PMEG2010EH_EJ_ET.pdf?src-supplier=Avnet+Europe; ComponentLink4Description: http://www.nxp.com/documents/data_sheet/PMEG2010EH_EJ_ET.pdf?src-supplier=Avnet+Europe; Supplier Part Number 1: 1727-3844-1-ND
L3 = AMDLA4530Q-4R7MT: FIXED IND 4.7UH 5A 52 MOHM SMD; Manufacturer: Abracon; Supplier 1: Digi-Key; Manufacturer Part Number: AMDLA4530Q-4R7MT; Stock 1: 963; Pricing 1: 1=1.08000, 10=1.00500, 25=0.92720, 50=0.77280, 100=0.72640, 250=0.64916, 500=0.55642 (USD); Supplier Part Number 1: 535-AMDLA4530Q-4R7MTCT-ND
R11 = WR02X9532FAL: Res 95.3K Ohm 1% 1/20W 0201; Manufacturer: Walsin Technologies; Supplier 1: Digi-Key; Manufacturer Part Number: WR02X9532FAL; Pricing 1: 15000=0.00247 (USD); Supplier Part Number 1: 1292-WR02X9532FALTR-ND
R12 = 0201WMJ0133TEE: 13kΩ ±5% 1/20W ±200ppm/℃ 0201 Chip Resistor - Surface Mount RoHS; Manufacturer: UNI-ROYAL(Uniroyal Elec); Package: 0201; Resistance: 13kΩ; Tolerance: ±5%; Power(Watts): 1/20W; Temperature Coefficient: ±200ppm/℃; Operating Temperature Range: -
R13 = WR02X105JAL: as R16 on sheet Connector_Section; Supplier 1: Digi-Key; Manufacturer Part Number: WR02X105JAL; RoHS: Yes; Category: Uncategorized; Stock 1: 6920; Pricing 1: 1=0.10000, 10=0.01800, 100=0.00750, 1000=0.00335, 2500=0.00291, 5000=0.00240 (USD); Case/Package: 0201; Min Operating Temperature: -55°C; Max Operating Temperature: 125°C; Resistor Type: Thick Film; Tolerance: 5%; Packaging: Tape and Reel; Length: 0.6mm; Depth: 0.3mm; Military Standard: Not; ComponentLink1URL: http://components.arrow.com/part/dataview/0323_00666329?src-supplier=Arrow+Europe; ComponentLink1Description: http://components.arrow.com/part/dataview/0323_00666329?src-supplier=Arrow+Europe; Supplier Part Number 1: 1292-WR02X105JALCT-ND
U6 = SY7304DBC: 33V 4A DFN-10 DC-DC Converters RoHS; Manufacturer: Silergy Corp; Function: Step-Up; Output Configuration: Positive; Topology: Boost; Output Type: Adjustable; Number of Outputs: 1; Voltage - Input (Min): 3V; Voltage - Output (Min/Fixed): 0.6V; Frequency - Switching: 1MHz; Package: DFN-10; Voltage - Input (Max): 33V; Voltage - Output (Max): 33V; Current - Output: 4A

## Sheet Peripheral_Section.SchDoc
size A4; DocumentNumber: 8; SheetNumber: 8; SheetTotal: 9
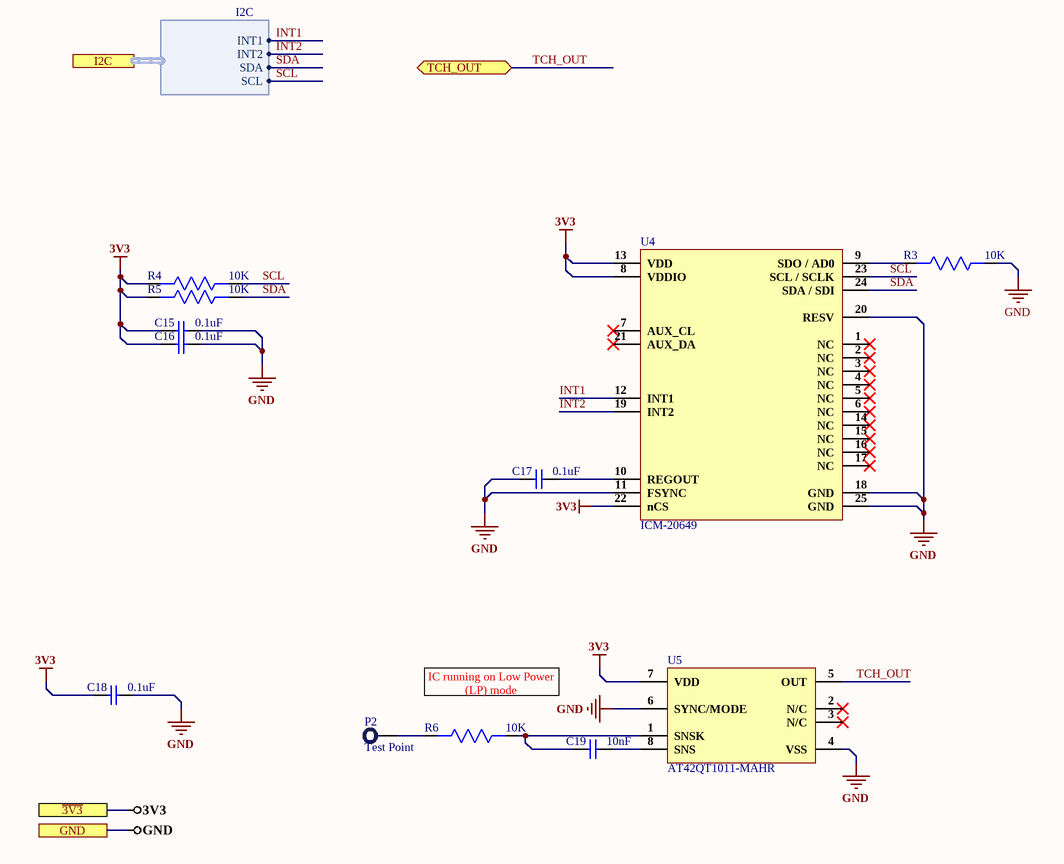
[diagram p6: Peripheral_Section.SchDoc]

### Parts
C15  0.1uF  [CAP 0201]
C16  0.1uF  [CAP 0201]
C17  0.1uF  [CAP 0201]
C18  0.1uF  [CAP 0201]
C19  10nF  [Cap0402]
P2  Test Point  [TEST POINT]
R3  10K  [Res-0201]
R4  10K  [Res-0201]
R5  10K  [Res-0201]
R6  10K  [Res-0201]
U4  ICM-20649  [24-QFN (3x3)]
U5  AT42QT1011-MAHR  [8-UDFN]

### Ports
GND, I2C (harness I2C), TCH_OUT (bidir), ~{3V3}

### Harnesses
I2C: INT1, INT2, SDA, SCL

### Nets
3V3: C15.1 C16.1 C18.1 R4.2 R5.2 U4.8(VDDIO) U4.13(VDD) U4.22(nCS) U5.7(VDD) ; port ~{3V3}
GND: C15.2 C16.2 C17.1 C18.2 R3.1 U4.11(FSYNC) U4.18(GND) U4.20(RESV) U4.25(GND) U5.4(VSS) U5.6(SYNC/MODE) ; port GND
INT1: U4.12(INT1) ; port I2C.INT1
INT2: U4.19(INT2) ; port I2C.INT2
SCL: R4.1 U4.23(SCL_/_SCLK) ; port I2C.SCL
SDA: R5.1 U4.24(SDA_/_SDI) ; port I2C.SDA
TCH_OUT: U5.5(OUT) ; port TCH_OUT
NetC17_2: C17.2 U4.10(REGOUT)
NetC19_1: C19.1 R6.1 U5.1(SNSK)
NetC19_2: C19.2 U5.8(SNS)
NetP2_1: P2.1 R6.2
NetR3_2: R3.2 U4.9(SDO_/_AD0)

Not connected (* = marked no-connect by the designer): U4 1(NC)* 2(NC)* 3(NC)* 4(NC)* 5(NC)* 6(NC)* 7(AUX_CL)* 14(NC)* 15(NC)* 16(NC)* 17(NC)* 21(AUX_DA)*; U5 2(N/C)* 3(N/C)*

### Notes on the sheet
- IC running on Low Power (LP) mode

### Library data of the parts
C15-C18 = GRM033R61E104KE14D: as C41 on sheet Connector_Section; Supplier 1: Mouser; Manufacturer Part Number: GRM033R61E104KE14D; RoHS: Yes; Category: Ceramic Capacitors; Stock 1: 22478; Pricing 1: 1=0.10000, 10=0.03100, 50=0.03100, 100=0.02500, 1000=0.01700, 10000=0.01400 (USD); Mount: Surface Mount; Case/Package: 0201; Case Code (Metric): 0603; Case Code (Imperial): 0201; Weight: 1.2E-05oz; Min Operating Temperature: -55°C; Max Operating Temperature: 85°C; Packaging: Tape and Reel; Tolerance: 10%; Dielectric: X5R; Termination: SMD/SMT; Resistor Type: Ceramic; Voltage Rating (DC): 25V; Package Quantity: 15000; Length: 0.024inch; Width: 0.012inch; Height: 0.3mm; Thickness: 0.013inch; Lead Free: Lead Free; RoHS Compliant: Yes; ComponentLink1URL: http://www.farnell.com/datasheets/2867843.pdf?src-supplier=Farnell; ComponentLink1Description: http://www.farnell.com/datasheets/2867843.pdf?src-supplier=Farnell; ComponentLink2URL: http://www.mouser.com/ds/2/281/c02e-2905.pdf?src-supplier=Mouser; ComponentLink2Description: http://www.mouser.com/ds/2/281/c02e-2905.pdf?src-supplier=Mouser; ComponentLink3URL: http://search.murata.co.jp/Ceramy/image/img/A01X/G101/ENG/GRM033R61E104KE14-01.pdf?src-supplier=Digi-Key; ComponentLink3Description: http://search.murata.co.jp/Ceramy/image/img/A01X/G101/ENG/GRM033R61E104KE14-01.pdf?src-supplier=Digi-Key; ComponentLink4URL: http://www.farnell.com/datasheets/2867843.pdf?src-supplier=Newark; ComponentLink4Description: http://www.farnell.com/datasheets/2867843.pdf?src-supplier=Newark; Supplier Part Number 1: 81-GRM033R61E104KE4D
C19 = CC0402KRX7R8BB103: CAP CER 10000PF 25V X7R 0402; Manufacturer: Yageo; Tolerance: 10%; Supplier 1: Digi-Key; Manufacturer Part Number: CC0402KRX7R8BB103; Stock 1: 0; Pricing 1: 1=0.1, 10=0.021, 100=0.0093, 500=0.00666, 1000=0.00523, 2500=0.00476, 5000=0.00438 (USD); Mount: Surface Mount; Case/Package: 0402; Case Code (Metric): 1005; Case Code (Imperial): 0402; Min Operating Temperature: -55°C; Max Operating Temperature: 125°C; Capacitance: 10nF; Dielectric: X7R; Voltage Rating: 25V; Package Quantity: 1; Packaging: Tape and Reel; Voltage Rating (DC): 25V; Termination: SMD/SMT; Composition: Ceramic; Length: 1mm; Height: 0.5mm; Depth: 0.5mm; Width: 0.02inch; Thickness: 0.022inch; Radiation Hardening: No; REACH SVHC: Unknown; Lead Free: Lead Free; Halogen Free: Halogen Free; ComponentLink1URL: http://www.yageo.com/documents/recent/UPY-GPHC_X7R_6.3V-to-50V_18.pdf?src-supplier=Digi-Key; ComponentLink1Description: http://www.yageo.com/documents/recent/UPY-GPHC_X7R_6.3V-to-50V_18.pdf?src-supplier=Digi-Key; ComponentLink2URL: https://www.verical.com/server-webapp/html/getDatasheet?partID=375418&src-supplier=Verical; ComponentLink2Description: https://www.verical.com/server-webapp/html/getDatasheet?partID=375418&src-supplier=Verical; ComponentLink3URL: http://www.yageo.com/documents/recent/UPY-GPHC_X7R_6.3V-to-50V_8.pdf?src-supplier=Avnet; ComponentLink3Description: http://www.yageo.com/documents/recent/UPY-GPHC_X7R_6.3V-to-50V_8.pdf?src-supplier=Avnet; ComponentLink4URL: https://4donline.ihs.com/images/VipMasterIC/IC/YAGO/YAGO-S-A0003557223/YAGO-S-A0003557223-1.pdf?hkey=52A5661711E402568146F3353EA87419&src-supplier=Element14; ComponentLink4Description: https://4donline.ihs.com/images/VipMasterIC/IC/YAGO/YAGO-S-A0003557223/YAGO-S-A0003557223-1.pdf?hkey=52A5661711E402568146F3353EA87419&src-supplier=Element14; ComponentLink5URL: http://www.farnell.com/datasheets/2167236.pdf?src-supplier=Element14; ComponentLink5Description: http://www.farnell.com/datasheets/2167236.pdf?src-supplier=Element14; ComponentLink6URL: http://www.mouser.com/ds/2/447/Yageo_UPY-GP_NP0_16V-to-50V_9-358835.pdf?src-supplier=Mouser; ComponentLink6Description: http://www.mouser.com/ds/2/447/Yageo_UPY-GP_NP0_16V-to-50V_9-358835.pdf?src-supplier=Mouser; Supplier Part Number 1: 311-1337-1-ND
P2 = TEST POINT: Test Point ON
R3-R6 = CR0201F10K0Q15Z: 10kΩ ±1% 1/20W ±200ppm/℃ 0201 Chip Resistor - Surface Mount RoHS; Manufacturer: Ever Ohms Tech; Package: 0201; Resistance: 10kΩ; Tolerance: ±1%; Power(Watts): 1/20W; Temperature Coefficient: ±200ppm/℃
U4 = ICM-20649: WIDE-FULL SCALE RANGE 6-AXIS MEM; Manufacturer: TDK InvenSense; Sensor Type: Accelerometer,Gyroscope,6 Axis,Temperature; Output Type: SPI,I2C; Supplier 1: Digi-Key; Manufacturer Part Number: ICM-20649; RoHS: Yes; Category: Inertial Measurement Units (IMUs); Stock 1: 4990; Pricing 1: 1=12.32000, 5=8.00000, 10=7.20000, 25=6.40000, 50=5.92000, 100=5.12000, 500=4.80000, 1000=4.48000 (USD); Mount: Surface Mount; Case/Package: QFN; Min Operating Temperature: -40°C; Max Operating Temperature: 85°C; Packaging: Tape and Reel; RoHS Compliant: Yes; Supplier Part Number 1: 1428-1142-1-ND
U5 = AT42QT1011-MAHR: IC SENSR TOUCH/PROX 1CH 8-UDFN; Manufacturer: Microchip; Supplier 1: Digi-Key; Manufacturer Part Number: AT42QT1011-MAHR; RoHS: No; Category: Integrated Circuits (ICs); Stock 1: 3160; Pricing 1: 1=0.61000, 25=0.56000, 100=0.50700 (USD); ComponentLink1URL: http://www.microchip.com/mymicrochip/filehandler.aspx?ddocname=en590560&src-supplier=Digi-Key; ComponentLink1Description: http://www.microchip.com/mymicrochip/filehandler.aspx?ddocname=en590560&src-supplier=Digi-Key; Supplier Part Number 1: AT42QT1011-MAHRCT-ND